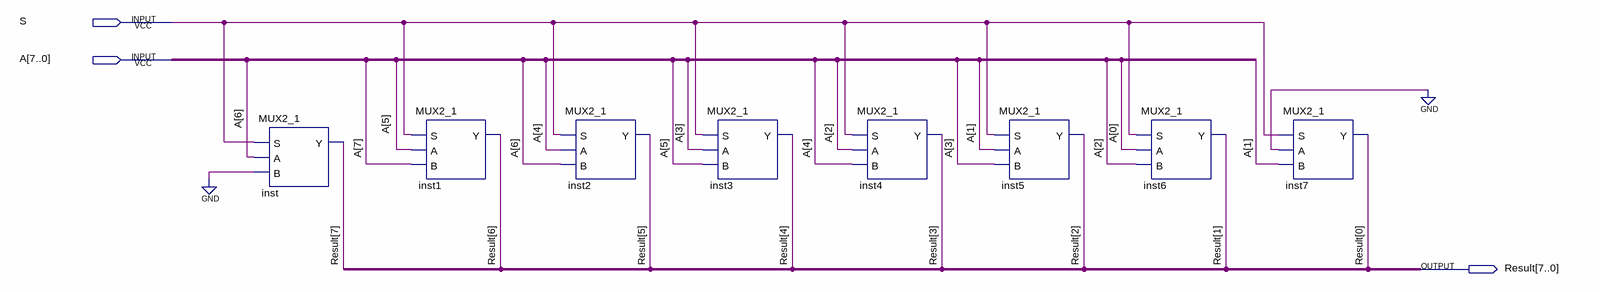
[diagram p0: schematic sheet]
// Quartus schematic Shifter_Left_Right.bdf as structural Verilog: 8 symbols, 3 pins
module Shifter_Left_Right (
  input  S,
  input  [7:0] A,
  output [7:0] Result
);

  MUX2_1 inst (.S(S), .A(A[6]), .B(1'b0), .Y(Result[7]));
  MUX2_1 inst1 (.S(S), .A(A[5]), .B(A[7]), .Y(Result[6]));
  MUX2_1 inst2 (.S(S), .A(A[4]), .B(A[6]), .Y(Result[5]));
  MUX2_1 inst3 (.S(S), .A(A[3]), .B(A[5]), .Y(Result[4]));
  MUX2_1 inst4 (.S(S), .A(A[2]), .B(A[4]), .Y(Result[3]));
  MUX2_1 inst5 (.S(S), .A(A[1]), .B(A[3]), .Y(Result[2]));
  MUX2_1 inst6 (.S(S), .A(A[0]), .B(A[2]), .Y(Result[1]));
  MUX2_1 inst7 (.S(S), .A(1'b0), .B(A[1]), .Y(Result[0]));
endmodule
